# Altium project 2027_09_15_RVM_EF_ver0.4.PrjPcb
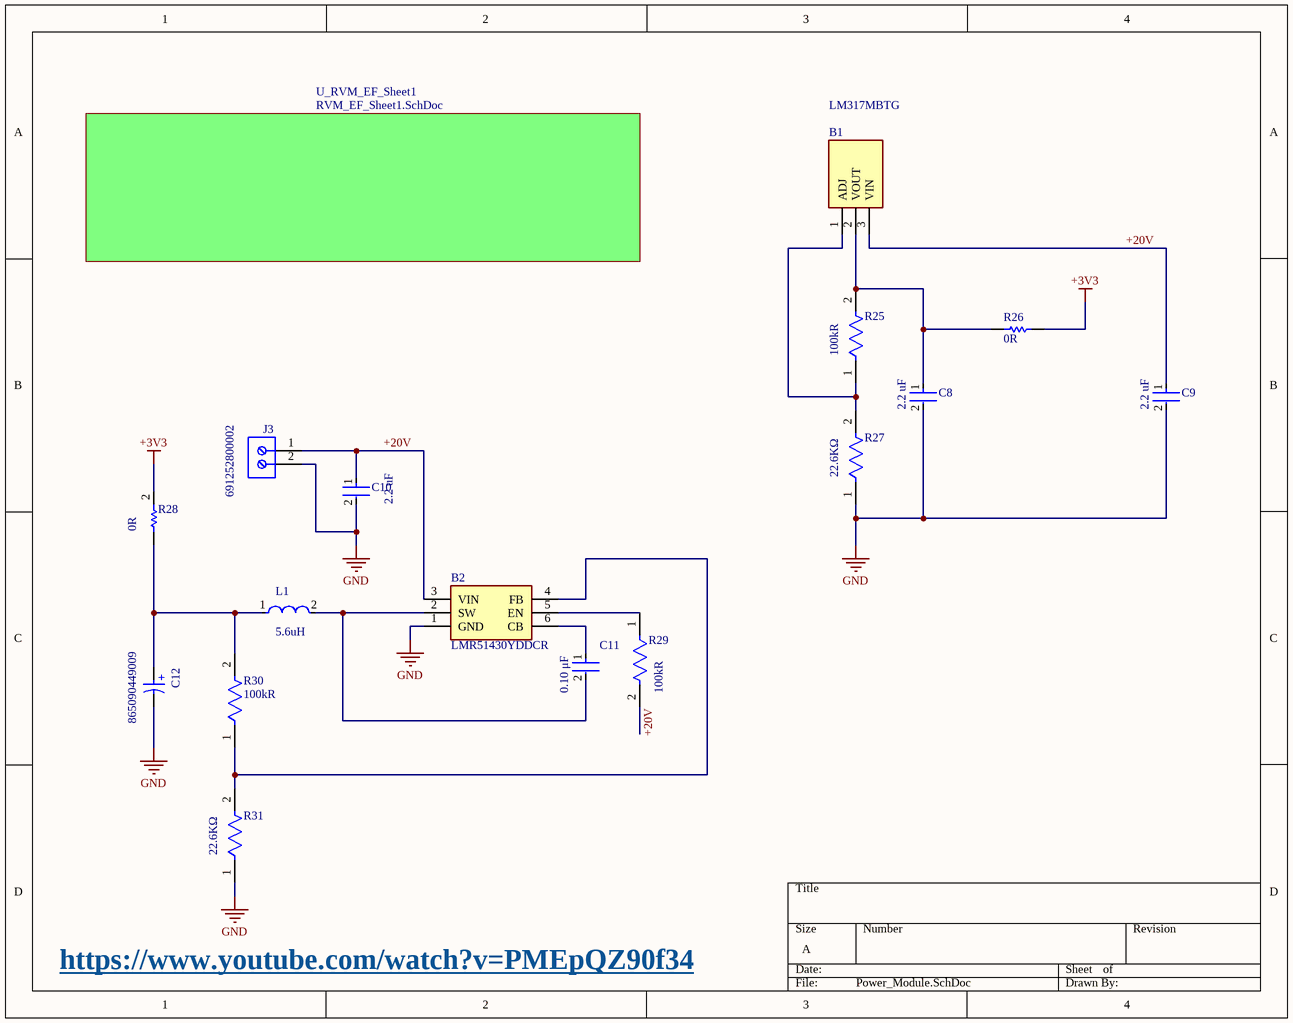
[diagram p0: Power_Module.SchDoc]
7 sheets, 92 parts. Net scope: flat (ports and power ports of the same name join across sheets).
Board file: RVM_EF_PCB1.PcbDoc
Sheets:
  Power_Module.SchDoc
    U_RVM_EF_Sheet1 = RVM_EF_Sheet1.SchDoc
      U_Voltage_Sense = Voltage_Sense.SchDoc
      U_Current_Sense = Current_Sense.SchDoc
      U_MCU_Module = MCU_Module.SchDoc
        U_LoRaModule = LoRaModule.SchDoc
        U_LED_blink = LED_blink.SchDoc

## Sheet Power_Module.SchDoc
size A; SheetNumber: 1; SheetTotal: 7

### Parts
B1  LM317MBTG  [TO254P482X997X2018-3P]
B2  LMR51430YDDCR  [SOT95P280X110-6N]
C8  value 2.2 uF  [FP-CC0805-0_85-MFG]  (hidden comment: CC0805KKX7R9BB225)
C9  value 2.2 uF  [FP-CC0805-0_85-MFG]  (hidden comment: CC0805KKX7R9BB225)
C10  value 2.2 uF  [FP-CC0805-0_85-MFG]  (hidden comment: CC0805KKX7R9BB225)
C11  value 0.10 μF  [FP-C1206C-EB-MFG]  (hidden comment: C1206C104F3GACTU)
C12  865090449009  [WCAP-ASLU_D8H6.5]
J3  691252800002  [691252800002]
L1  Inductance: 5.6uH  [FP-IHLP-3232CZ-FP_2_413x5-MFG]  (hidden comment: IHLP3232CZER5R6M01)
R25  Resistance: 100kR  [FP-MCU0805-IPC_B]  (hidden comment: MCU08050D1003BP500)
R26  value 0R  [RESC2013X60X35LL10T20]  (hidden comment: RC0805JR-130RL)
R27  value 22.6KΩ  [FP-RT0805-MFG]  (hidden comment: RT0805WRD0722K6L)
R28  value 0R  [RESC2013X60X35LL10T20]  (hidden comment: RC0805JR-130RL)
R29  Resistance: 100kR  [FP-MCU0805-IPC_B]  (hidden comment: MCU08050D1003BP500)
R30  Resistance: 100kR  [FP-MCU0805-IPC_B]  (hidden comment: MCU08050D1003BP500)
R31  value 22.6KΩ  [FP-RT0805-MFG]  (hidden comment: RT0805WRD0722K6L)

### Sub-sheets
U_RVM_EF_Sheet1 = RVM_EF_Sheet1.SchDoc: no entries

### Nets
+3V3: R26.1 R28.2
GND: B2.1(GND) C8.2 C9.2 C10.2 C12.2(N) J3.2 R27.1 R31.1
+20V: B1.3(VIN) B2.3(VIN) C9.1 C10.1 J3.1 R29.2
NetB1_1: B1.1(ADJ) R25.1 R27.2
NetB1_2: B1.2(VOUT) C8.1 R25.2 R26.2
NetB2_2: B2.2(SW) C11.2 L1.2
NetB2_4: B2.4(FB) R30.1 R31.2
NetB2_5: B2.5(EN) R29.1
NetB2_6: B2.6(CB) C11.1
NetC12_1: C12.1(P) L1.1 R28.1 R30.2

### Notes on the sheet
- https://www.youtube.com/watch?v=PMEpQZ90f34
- (in symbol CMP-03913-54202517-2) +

### Library data of the parts
B1 = LM317MBTG: Internal Short Circuit Current Limiting; Internal Thermal Overload Protection; Output Current in Excess of 500 mA; Output Transistor Safe-Area Compensation; Output Adjustable between 1.2 V and 37 V; Floating Operation for High Voltage Applications; Eliminates Stocking Many Fixed Voltages; Pb-Free Packages are Available; NCV Prefix for Automotive and Other Applications Requiring Site Control Changes; Manufacturer_Name: onsemi; Geometry.Height: 4.82mm; Mouser Part Number: 863-LM317MBTG; Mouser Price/Stock: https://www.mouser.co.uk/ProductDetail/onsemi/LM317MBTG?qs=2OtswVQKCOHWWQM%252BNYhxOw%3D%3D; Manufacturer_Part_Number: LM317MBTG; Datasheet Link: https://www.onsemi.com/pub/Collateral/LM317M-D.PDF
B2 = LMR51430YDDCR: Switching Voltage Regulators SIMPLE SWITCHER&reg; 4.5-V to 36-V, 3-A synchronous buck converter with 40-&micro;A IQ; Manufacturer_Name: Texas Instruments; Geometry.Height: 1.1mm; Mouser Part Number: 595-LMR51430YDDCR; Mouser Price/Stock: https://www.mouser.co.uk/ProductDetail/Texas-Instruments/LMR51430YDDCR?qs=vvQtp7zwQdMdLcsY5sFiMg%3D%3D; Manufacturer_Part_Number: LMR51430YDDCR; Datasheet Link: https://www.ti.com/lit/ds/symlink/lmr51430.pdf?ts=1657817980313&ref_url=https%253A%252F%252Fwww.ti.com%252Fproduct%252FLMR51430%253FkeyMatch%253DLMR51430%2526tisearch%253Dsearch-everything%2526usecase%253DGPN
C8-C10 = CMP-03422-001390-1: CAP CER 2.2UF 50V X7R 0805; Manufacturer: Yageo; Tolerance: 0.1; Material: Ceramic; ComponentLink2Description: Datasheet; ComponentLink2URL: http://www.yageo.com/documents/recent/UPY-GPHC_Y5V_6.3V-to-50V_8.pdf; Voltage Rating: 50 V; Device Class L2: Capacitors; Footprint Url: http://www.yageo.com/exep/pages/download/literatures/UPY-C_GEN_24.pdf; Device Class L3: Ceramic Capacitors; Temperature Range High: +85°C; Category: Cap; Lead Free: Yes; Height: 0.95mm; Automotive: No; Temperature Range Low: -30°C; Octopart: https://octopart.com/cc0805kkx7r9bb225-yageo-51849248; Temperature Characteristic: X7R; Ipc Land Pattern Name: CAPC200125X85; Mouser Description: 0805 50 V 2.2 uF ±10% Tolerance X7R Multilayer Ceramic Capacitor; RoHS: TRUE; Temperature: -30°C to +85°C; Capacitance: 2.2 uF; Package: CC0805-0.85; Digikey Description: CAP CER 2.2UF 50V X7R 0805; Manufacturer Part Number: CC0805KKX7R9BB225; Device Class L1: Passive Components
C11 = CMP-1037-04186-2: CAP CER 0.1UF 25V C0G/NP0 1206; Manufacturer: KEMET; Material: Ceramic; Temperature Characteristic: C0G; Temperature Coefficient: 15%; Tolerance: 0.01; Automotive Grade: Grade 0; Device Class L3: Ceramic Capacitors; Voltage Rating: 25 V; Temperature Range Low: -55°C; RoHS: TRUE; Package: C1206C-EB; Category: Cap; Lead Free: Yes; Manufacturer Part Number: C1206C104F3GACTU; ComponentLink2URL: https://content.kemet.com/datasheets/KEM_C1007_X8R_ULTRA_150C_SMD.pdf; Ipc Land Pattern Name: CAPC320160X78; Temperature Range High: +150°C; Height: 0.88mm; Digikey Description: CAP CER 0.1UF 25V C0G/NP0 1206; ComponentLink2Description: Datasheet; Capacitance: 0.10 μF; Mouser Description: Multilayer Ceramic Capacitors MLCC - SMD/SMT 25volts 0.1uF 1% C0G; Octopart: https://octopart.com/c1206c104f3gactu-kemet-13149870; Device Class L1: Passive Components; Device Class L2: Capacitors; Automotive: Yes; Temperature: -55°C to +150°C
C12 = CMP-03913-54202517-2: WCAP-ASLU Aluminum Electrolytic Capacitors; Capacitance: 100µF; Voltage Rating: 25V; Ripple Current: 110mA; Leakage Current: 5µA; Insulation Resistance: 1MΩ; Polarity: Polar; Life (Hours): 1000hours; Tolerance: 20%; Mount: Surface Mount; RoHS: Compliant; Max Operating Temperature: 85°C; Height: 6.5mm; Min Operating Temperature: -40°C; Case/Package: Radial; Length: 6.5mm; Width: 8.3mm; Voltage Rating (DC): 25V; Height - Seated (Max): 6.5024mm; Ripple Current (AC): 110mA; REACH SVHC: Unknown; Diameter: 8mm
J3 = CMP-1502-02796-3: Terminal Block, 10MM Pitch, Vertical, Rising Cage Clamp, 12-30 AWG, 2 Pin
L1 = CMP-02424-000712-1: Commercial Inductors, High Saturation Series 5.6uH 6.3A 37.2mΩ 20%; DC Resistance (DCR): 37.2mR; Test Frequency: 100kHz; Max DC Current: 10A; Shielding: Shielded; Self Resonant Frequency: 21MHz; Core Material: Ferrite; Length: 0.34inch; Package Quantity: 1000; Radiation Hardening: No; Saturation Current: 10A; Depth: 8.26mm; Inductance Tolerance: 20%; Current Rating: 6.3A; Packaging: Tape and Reel; Tolerance: 20%; Series: IHLP-3232CZ-01; Width: 8.18mm; RMS Current (Irms): 6.3A; Mount: Surface Mount; Case/Package: 3232; Termination: SMD/SMT; Rated Current-Max: 6.3A; Height: 3mm; Number of Pins: 2; Max Operating Temperature: 125°C; RoHS Compliant: Yes; Military Standard: Not; Lead Free: Lead Free; Min Operating Temperature: -55°C
R25 R29 R30 = CMP-02407-000489-1: RES 1.05K OHM 0.5% 1/5W 0805; Tolerance: 0.1%; Voltage Rating: 150V; Temperature Coefficient: 25ppm/°C; Power Rating: 125mW; REACH SVHC: No SVHC; Radiation Hardening: No; Composition: Thin Film; Contact Plating: Tin; Lead Free: Lead Free; Max Operating Temperature: 125°C; Width: 1.25mm; Case/Package: 0805; Depth: 1.25mm; Packaging: Tape and Reel; Case Code (Imperial): 0805; Length: 2mm; Case Code (Metric): 2012; Min Operating Temperature: -55°C; Voltage Rating (DC): 150V; Military Standard: Not
R26 R28 = CMP-2001-01414-1: Manufacturer: Yageo; Part Number: RC0805JR-130RL
R27 R31 = CMP-03412-025351-1: RES SMD 22.6KOHM 0.05% 1/8W 0805; Manufacturer: Yageo; Power Rating: 0.125W; Voltage Rating: 150V; Temperature Coefficient: 25 ppm/°C; Tolerance: 0.001; Footprint Url: http://www.yageo.com/exep/pages/download/literatures/PYu-R_Mount_10.pdf; Package: RT0805; Device Class L3: Chip SMD Resistors; Height: 0.6mm; Temperature Range High: +155°C; ComponentLink2Description: Datasheet; Manufacturer Part Number: RT0805WRD0722K6L; Temperature Range Low: -55°C; Temperature: -55°C to +155°C; Lead Free: Yes; Resistance: 22.6KΩ; Automotive: No; Series: RT; Digikey Description: RES SMD 22.6KOHM 0.05% 1/8W 0805; Octopart: https://octopart.com/rt0805wrd0722k6l-yageo-71401359; Category: Res; ComponentLink2URL: http://www.yageo.com/documents/recent/PYu-RT_1-to-0.01_RoHS_L_9.pdf; Ipc Land Pattern Name: RESC200125X50; Composition: Thin Film; Device Class L2: Resistors; Device Class L1: Passive Components; RoHS: TRUE

## Sheet RVM_EF_Sheet1.SchDoc
size A4; SheetNumber: 2; SheetTotal: 6
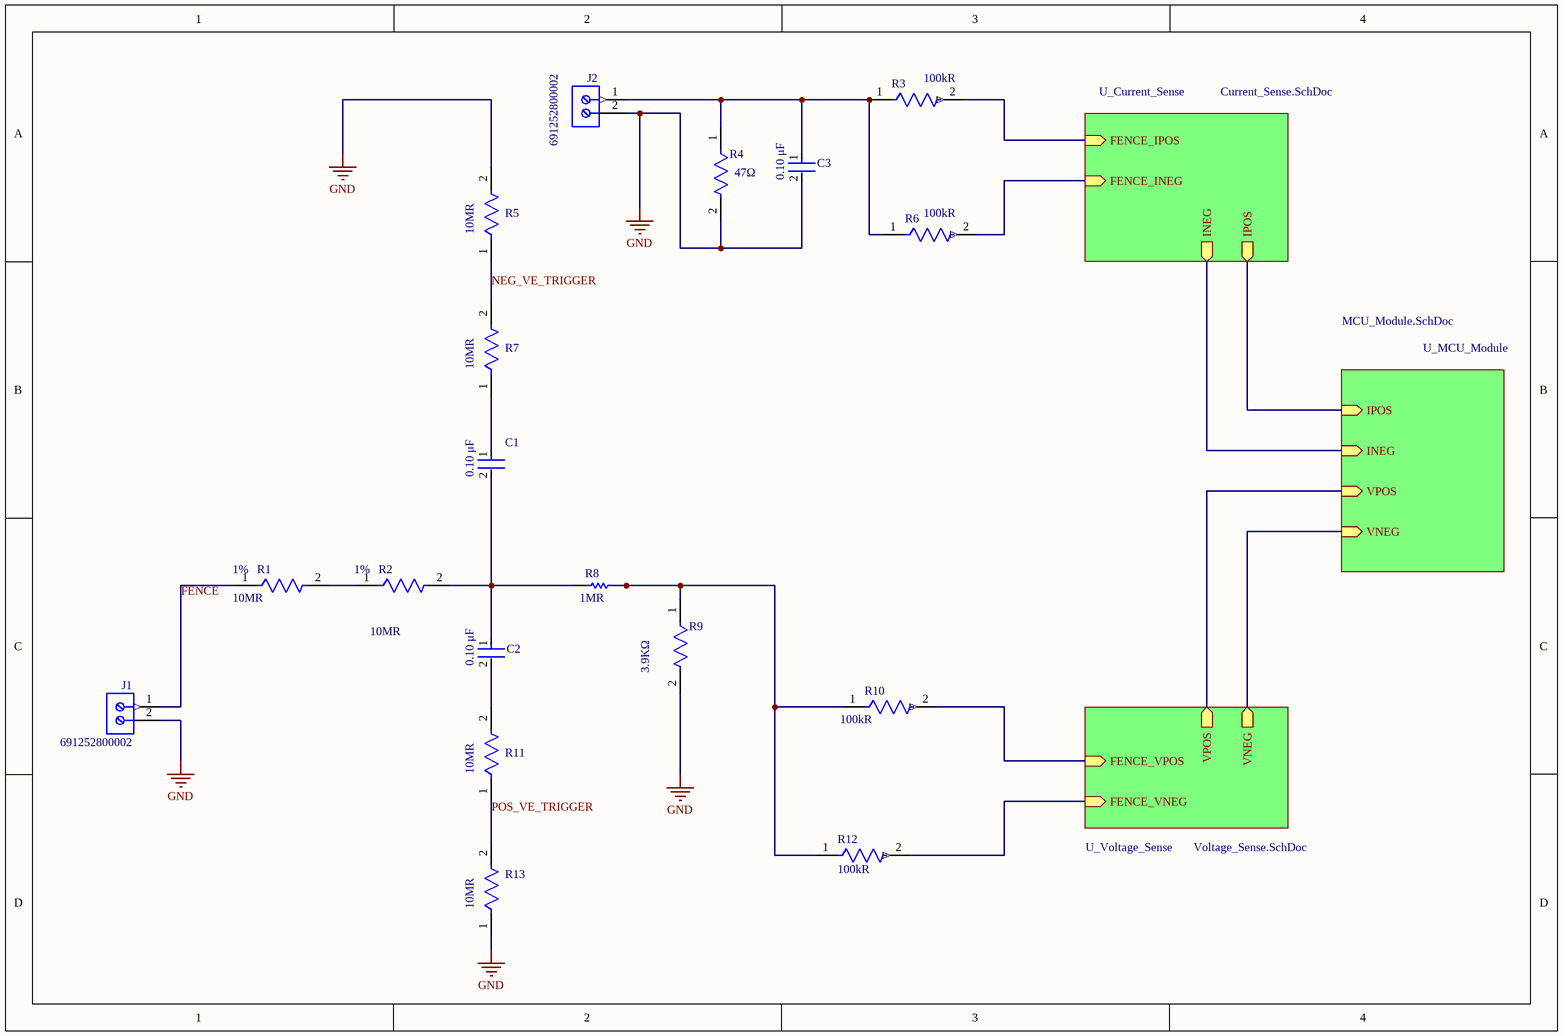
[diagram p1: RVM_EF_Sheet1.SchDoc]

### Parts
C1  value 0.10 μF  [FP-C1206C-EB-MFG]  (hidden comment: C1206C104F3GACTU)
C2  value 0.10 μF  [FP-C1206C-EB-MFG]  (hidden comment: C1206C104F3GACTU)
C3  value 0.10 μF  [FP-C1206C-EB-MFG]  (hidden comment: C1206C104F3GACTU)
J1  691252800002  [691252800002]
J2  691252800002  [691252800002]
R1  Tolerance: 1%  Resistance: 10MR  [FP-CRCW2512-e3-IPC_A]  (hidden comment: CRCW251210M0FKEH)
R2  Tolerance: 1%  Resistance: 10MR  [FP-CRCW2512-e3-IPC_A]  (hidden comment: CRCW251210M0FKEH)
R3  Resistance: 100kR  [FP-MCU0805-IPC_B]  (hidden comment: MCU08050D1003BP500)
R4  Resistance: 47Ω  [FP-RT1206-MFG]  (hidden comment: RT1206FRE0747RL)
R5  Resistance: 10MR  [FP-CRCW0805-e3-MFG]  (hidden comment: CRCW080510M0FKEC)
R6  Resistance: 100kR  [FP-MCU0805-IPC_B]  (hidden comment: MCU08050D1003BP500)
R7  Resistance: 10MR  [FP-CRCW0805-e3-MFG]  (hidden comment: CRCW080510M0FKEC)
R8  value 1MR  [RESC0805(2012)_N]  (hidden comment: 1M 1% 0805(2012))
R9  value 3.9KΩ  [FP-RT0805-MFG]  (hidden comment: RT0805DRD073K9L)
R10  Resistance: 100kR  [FP-MCU0805-IPC_B]  (hidden comment: MCU08050D1003BP500)
R11  Resistance: 10MR  [FP-CRCW0805-e3-MFG]  (hidden comment: CRCW080510M0FKEC)
R12  Resistance: 100kR  [FP-MCU0805-IPC_B]  (hidden comment: MCU08050D1003BP500)
R13  Resistance: 10MR  [FP-CRCW0805-e3-MFG]  (hidden comment: CRCW080510M0FKEC)

### Sub-sheets
U_Current_Sense = Current_Sense.SchDoc: FENCE_IPOS (in), FENCE_INEG (in), IPOS (out), INEG (out)
U_MCU_Module = MCU_Module.SchDoc: IPOS (in), INEG (in), VPOS (in), VNEG (in)
U_Voltage_Sense = Voltage_Sense.SchDoc: FENCE_VPOS (in), FENCE_VNEG (in), VPOS (out), VNEG (out)

### Nets
GND: C3.2 J1.2 J2.2 R4.2 R5.2 R9.2 R13.1
FENCE: J1.1 R1.1
NEG_VE_TRIGGER: R5.1 R7.2
POS_VE_TRIGGER: R11.1 R13.2
NetC1_1: C1.1 R7.1
NetC1_2: C1.2 C2.1 R2.2 R8.1
NetC2_2: C2.2 R11.2
NetC3_1: C3.1 J2.1 R3.1 R4.1 R6.1
NetR1_2: R1.2 R2.1
NetR3_2: R3.2 ; sheet U_Current_Sense/FENCE_IPOS
NetR6_2: R6.2 ; sheet U_Current_Sense/FENCE_INEG
NetR8_2: R8.2 R9.1 R10.1 R12.1
NetR10_2: R10.2 ; sheet U_Voltage_Sense/FENCE_VPOS
NetR12_2: R12.2 ; sheet U_Voltage_Sense/FENCE_VNEG
(unnamed): sheet U_Voltage_Sense/VPOS, sheet U_MCU_Module/VPOS
(unnamed): sheet U_Voltage_Sense/VNEG, sheet U_MCU_Module/VNEG
(unnamed): sheet U_Current_Sense/IPOS, sheet U_MCU_Module/IPOS
(unnamed): sheet U_Current_Sense/INEG, sheet U_MCU_Module/INEG

### Library data of the parts
C1-C3 = CMP-1037-04186-2: as C11 on sheet Power_Module; Device Class L3: Ceramic Capacitors; Voltage Rating: 25 V; Temperature Range Low: -55°C; RoHS: TRUE; Package: C1206C-EB; Category: Cap; Lead Free: Yes; Manufacturer Part Number: C1206C104F3GACTU; ComponentLink2URL: https://content.kemet.com/datasheets/KEM_C1007_X8R_ULTRA_150C_SMD.pdf; Ipc Land Pattern Name: CAPC320160X78; Temperature Range High: +150°C; Height: 0.88mm; Digikey Description: CAP CER 0.1UF 25V C0G/NP0 1206; ComponentLink2Description: Datasheet; Capacitance: 0.10 μF; Mouser Description: Multilayer Ceramic Capacitors MLCC - SMD/SMT 25volts 0.1uF 1% C0G; Octopart: https://octopart.com/c1206c104f3gactu-kemet-13149870; Device Class L1: Passive Components; Device Class L2: Capacitors; Automotive: Yes; Temperature: -55°C to +150°C
J1 J2 = CMP-1502-02796-3: as J3 on sheet Power_Module
R1 R2 = CMP-1018-00962-2: RES Thick Film, 10MΩ, 1%, 1W, 100ppm/°C, 2512; Height: 0.028inch; Min Operating Temperature: -55°C; Number of Terminations: 2; Lead Free: Lead Free; Composition: Thick Film; Packaging: Tape and Reel; Case/Package: 2512; Length: 0.248inch; Max Power Dissipation: 1W; Temperature Coefficient: 100ppm/°C; Max Operating Temperature: 155°C; Features: Automotive AEC-Q200; Width: 0.124inch
R3 R6 R10 R12 = CMP-02407-000489-1: as R25 on sheet Power_Module; REACH SVHC: No SVHC; Radiation Hardening: No; Composition: Thin Film; Contact Plating: Tin; Lead Free: Lead Free; Max Operating Temperature: 125°C; Width: 1.25mm; Case/Package: 0805; Depth: 1.25mm; Packaging: Tape and Reel; Case Code (Imperial): 0805; Length: 2mm; Case Code (Metric): 2012; Min Operating Temperature: -55°C; Voltage Rating (DC): 150V; Military Standard: Not
R4 = CMP-2003-04115-2: RES SMD 47 OHM 1% 1/4W 1206; Manufacturer: Yageo; Voltage Rating: 200V; Value: 47Ω; Temperature Coefficient: 50 ppm/°C; Tolerance: 0.0002; Power Rating: 0.25W; Temperature Range High: +155°C; Category: Res; Temperature Range Low: -55°C; Device Class L3: Chip SMD Resistors; Temperature: -55°C to +155°C; RoHS: TRUE; Composition: Thin Film; Digikey Description: RES SMD 47 OHM 1% 1/4W 1206; Lead Free: Yes; Series: RT; Automotive: No; ComponentLink2Description: Datasheet; Device Class L2: Resistors; Ipc Land Pattern Name: RESC310160X55; ComponentLink2URL: http://www.yageo.com/documents/recent/PYu-RT_1-to-0.01_RoHS_L_9.pdf; Manufacturer Part Number: RT1206FRE0747RL; Device Class L1: Passive Components; Mouser Description: Thin Film Resistors - SMD 1/4W 47 ohm 1% 50ppm; Package: RT1206; Octopart: https://octopart.com/rt1206fre0747rl-yageo-1461420; Footprint Url: http://www.yageo.com/exep/pages/download/literatures/PYu-R_Mount_10.pdf; Height: 0.65mm
R5 R7 R11 R13 = CMP-02407-002899-1: RES Thick Film, 10MΩ, 1%, 0.125W, 100ppm/°C, 0805; Max Power Dissipation: 125mW; Width: 0.049inch; Features: Automotive AEC-Q200; Max Operating Temperature: 155°C; Composition: Thick Film; Tolerance: 1%; Min Operating Temperature: -55°C; Lead Free: Lead Free; Depth: 1.25mm; Length: 0.079inch; Package Quantity: 20000; Height: 0.02inch; Military Standard: Not; Number of Terminations: 2; Case/Package: 0805; Packaging: Tape and Reel; Temperature Coefficient: 100ppm/°C
R8 = CMP-1013-00849-1: 1M 0.125W 1% 0805 (2012 Metric)  SMD; Case-Metric: 2012; Case-EIA: 0805; Technology: SMT; Power: 0.125 W; Tolerance: 1 %
R9 = CMP-03412-007263-1: RES SMD 3.9K OHM 0.5% 1/8W 0805; Manufacturer: Yageo; Voltage Rating: 150V; Power Rating: 0.125W; Tolerance: 0.01; Temperature Coefficient: 25 ppm/°C; Footprint Url: http://www.yageo.com/exep/pages/download/literatures/PYu-R_Mount_10.pdf; Package: RT0805; Ipc Land Pattern Name: RESC200125X50; Composition: Thin Film; Automotive: No; ComponentLink2Description: Datasheet; Height: 0.6mm; Device Class L1: Passive Components; Device Class L2: Resistors; ComponentLink2URL: http://www.yageo.com/documents/recent/PYu-RT_1-to-0.01_RoHS_L_9.pdf; Manufacturer Part Number: RT0805DRD073K9L; Temperature Range Low: -55°C; Digikey Description: RES SMD 3.9K OHM 0.5% 1/8W 0805; Series: RT; Octopart: https://octopart.com/rt0805drd073k9l-yageo-1265808; Resistance: 3.9KΩ; Temperature Range High: +155°C; RoHS: TRUE; Lead Free: Yes; Category: Res; Device Class L3: Chip SMD Resistors; Temperature: -55°C to +155°C

## Sheet Voltage_Sense.SchDoc
size A4; SheetNumber: 3; SheetTotal: 6
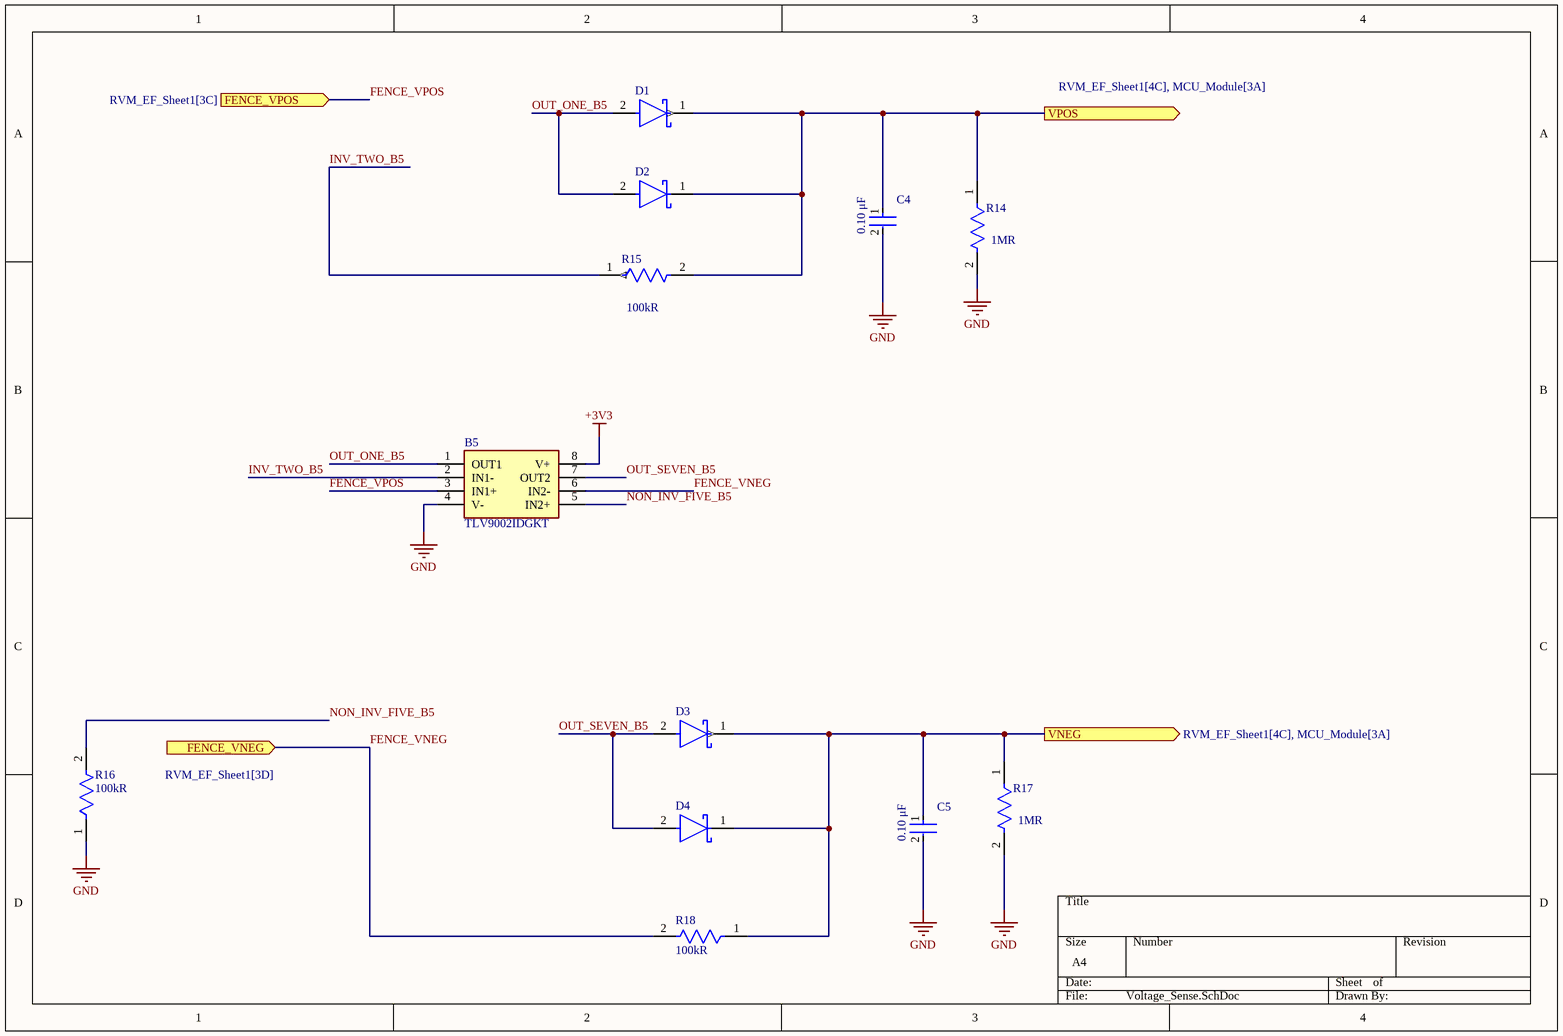
[diagram p2: Voltage_Sense.SchDoc]

### Parts
B5  TLV9002IDGKT  [SOIC127P610X140-8M]
C4  value 0.10 μF  [FP-C1206C-EB-MFG]  (hidden comment: C1206C104F3GACTU)
C5  value 0.10 μF  [FP-C1206C-EB-MFG]  (hidden comment: C1206C104F3GACTU)
D1  PMEG3010BER,115  [FP-SOD123W-MFG]  (value not drawn)
D2  PMEG3010BER,115  [FP-SOD123W-MFG]  (value not drawn)
D3  PMEG3010BER,115  [FP-SOD123W-MFG]  (value not drawn)
D4  PMEG3010BER,115  [FP-SOD123W-MFG]  (value not drawn)
R14  Resistance: 1MR  [FP-RMCF0805-IPC_A]  (hidden comment: RMCF0805FT1M00)
R15  Resistance: 100kR  [FP-MCU0805-IPC_B]  (hidden comment: MCU08050D1003BP500)
R16  Resistance: 100kR  [FP-MCU0805-IPC_B]  (hidden comment: MCU08050D1003BP500)
R17  Resistance: 1MR  [FP-RMCF0805-IPC_A]  (hidden comment: RMCF0805FT1M00)
R18  Resistance: 100kR  [FP-MCU0805-IPC_B]  (hidden comment: MCU08050D1003BP500)

### Ports
FENCE_VNEG (in, see RVM_EF_Sheet1[3D]), FENCE_VPOS (in, see RVM_EF_Sheet1[3C]), VNEG (out, see RVM_EF_Sheet1[4C], MCU_Module[3A]), VPOS (out, see RVM_EF_Sheet1[4C], MCU_Module[3A])

### Nets
+3V3: B5.8(V+)
GND: B5.4(V-) C4.2 C5.2 R14.2 R16.1 R17.2
FENCE_VNEG: B5.6(IN2-) R18.2 ; port FENCE_VNEG
FENCE_VPOS: B5.3(IN1+) ; port FENCE_VPOS
INV_TWO_B5: B5.2(IN1-) R15.1
NON_INV_FIVE_B5: B5.5(IN2+) R16.2
OUT_ONE_B5: B5.1(OUT1) D1.2(A) D2.2(A)
OUT_SEVEN_B5: B5.7(OUT2) D3.2(A) D4.2(A)
VNEG: C5.1 D3.1(K) D4.1(K) R17.1 R18.1 ; port VNEG
VPOS: C4.1 D1.1(K) D2.1(K) R14.1 R15.2 ; port VPOS

### Library data of the parts
B5 = TLV9002IDGKT: 2-Channel, 1MHz, RRIO, 1.8V to 5.5V Operational Amplifier for Cost-Optimized Systems; Manufacturer_Name: Texas Instruments; Geometry.Height: 1.1mm; Mouser Part Number: 595-TLV9002IDGKT; Mouser Price/Stock: https://www.mouser.co.uk/ProductDetail/Texas-Instruments/TLV9002IDGKT?qs=wUXugUrL1qxkc8vIM2YvZQ%3D%3D; Manufacturer_Part_Number: TLV9002IDGKT; Datasheet Link: https://www.ti.com/lit/ds/symlink/tlv9002.pdf?ts=1635497933449
C4 C5 = CMP-1037-04186-2: as C11 on sheet Power_Module; Device Class L3: Ceramic Capacitors; Voltage Rating: 25 V; Temperature Range Low: -55°C; RoHS: TRUE; Package: C1206C-EB; Category: Cap; Lead Free: Yes; Manufacturer Part Number: C1206C104F3GACTU; ComponentLink2URL: https://content.kemet.com/datasheets/KEM_C1007_X8R_ULTRA_150C_SMD.pdf; Ipc Land Pattern Name: CAPC320160X78; Temperature Range High: +150°C; Height: 0.88mm; Digikey Description: CAP CER 0.1UF 25V C0G/NP0 1206; ComponentLink2Description: Datasheet; Capacitance: 0.10 μF; Mouser Description: Multilayer Ceramic Capacitors MLCC - SMD/SMT 25volts 0.1uF 1% C0G; Octopart: https://octopart.com/c1206c104f3gactu-kemet-13149870; Device Class L1: Passive Components; Device Class L2: Capacitors; Automotive: Yes; Temperature: -55°C to +150°C
D1-D4 = CMP-14398-000004-1: DIODE SCHOTTKY 30V 1A SOD123W; Manufacturer: Nexperia; Automotive Grade: Grade 0; Max Surge Forward Current: 50A; Peak Reverse Current: 15uA; Max Junction Temp: +150°C; Capacitance: 170pF; Value: 170pF; ComponentLink2URL: https://assets.nexperia.com/documents/data-sheet/PMEG3010BER.pdf; Reverse Voltage: 30V; Forward Current: 1A; Ambient Temperature Range Low: -55°C; Ambient Temperature Range High: +150°C; Octopart: https://octopart.com/pmeg3010ber%2C115-nexperia-78741454; Package: SOD123W; Category: Diode; Lead Free: Yes; Digikey Description: DIODE SCHOTTKY 30V 1A SOD123W; Automotive: Yes; RoHS: TRUE; Height: 1.1mm; Temperature: to +150°C; Device Class L2: Diodes; ComponentLink2Description: Datasheet; Manufacturer Part Number: PMEG3010BER,115; Temperature Range High: +150°C; Device Class L3: Schottky Diodes; Device Class L1: Discrete Semiconductors; Footprint Url: https://assets.nexperia.com/documents/outline-drawing/SOD123W.pdf
R14 R17 = CMP-26527-007472-1: 1MΩ ±1% 0.125W 0805 Thick Film Chip Resistor AEC-Q200 compliant; Max Power Dissipation: 125mW; Temperature Coefficient: 100ppm/°C; Lead Free: Lead Free; Depth: 1.25mm; Power Rating: 125mW; Mount: Surface Mount; Length: 2mm; Max Operating Temperature: 155°C; Packaging: Tape and Reel; Size Code: 0805; Contact Plating: Tin; Min Operating Temperature: -55°C; Resistor Type: Thick Film; Height: 0.026inch; Military Standard: Not; Features: Automotive AEC-Q200; Radiation Hardening: No; Case Code (Metric): 2012; Tolerance: 1%; Construction: Rectangular; RoHS Compliant: Yes; Number of Terminations: 2; Width: 0.049inch; Case Code (Imperial): 0805; Case/Package: 0805; Series: RMCF
R15 R16 R18 = CMP-02407-000489-1: as R25 on sheet Power_Module; REACH SVHC: No SVHC; Radiation Hardening: No; Composition: Thin Film; Contact Plating: Tin; Lead Free: Lead Free; Max Operating Temperature: 125°C; Width: 1.25mm; Case/Package: 0805; Depth: 1.25mm; Packaging: Tape and Reel; Case Code (Imperial): 0805; Length: 2mm; Case Code (Metric): 2012; Min Operating Temperature: -55°C; Voltage Rating (DC): 150V; Military Standard: Not

## Sheet Current_Sense.SchDoc
size A4; SheetNumber: 4; SheetTotal: 7
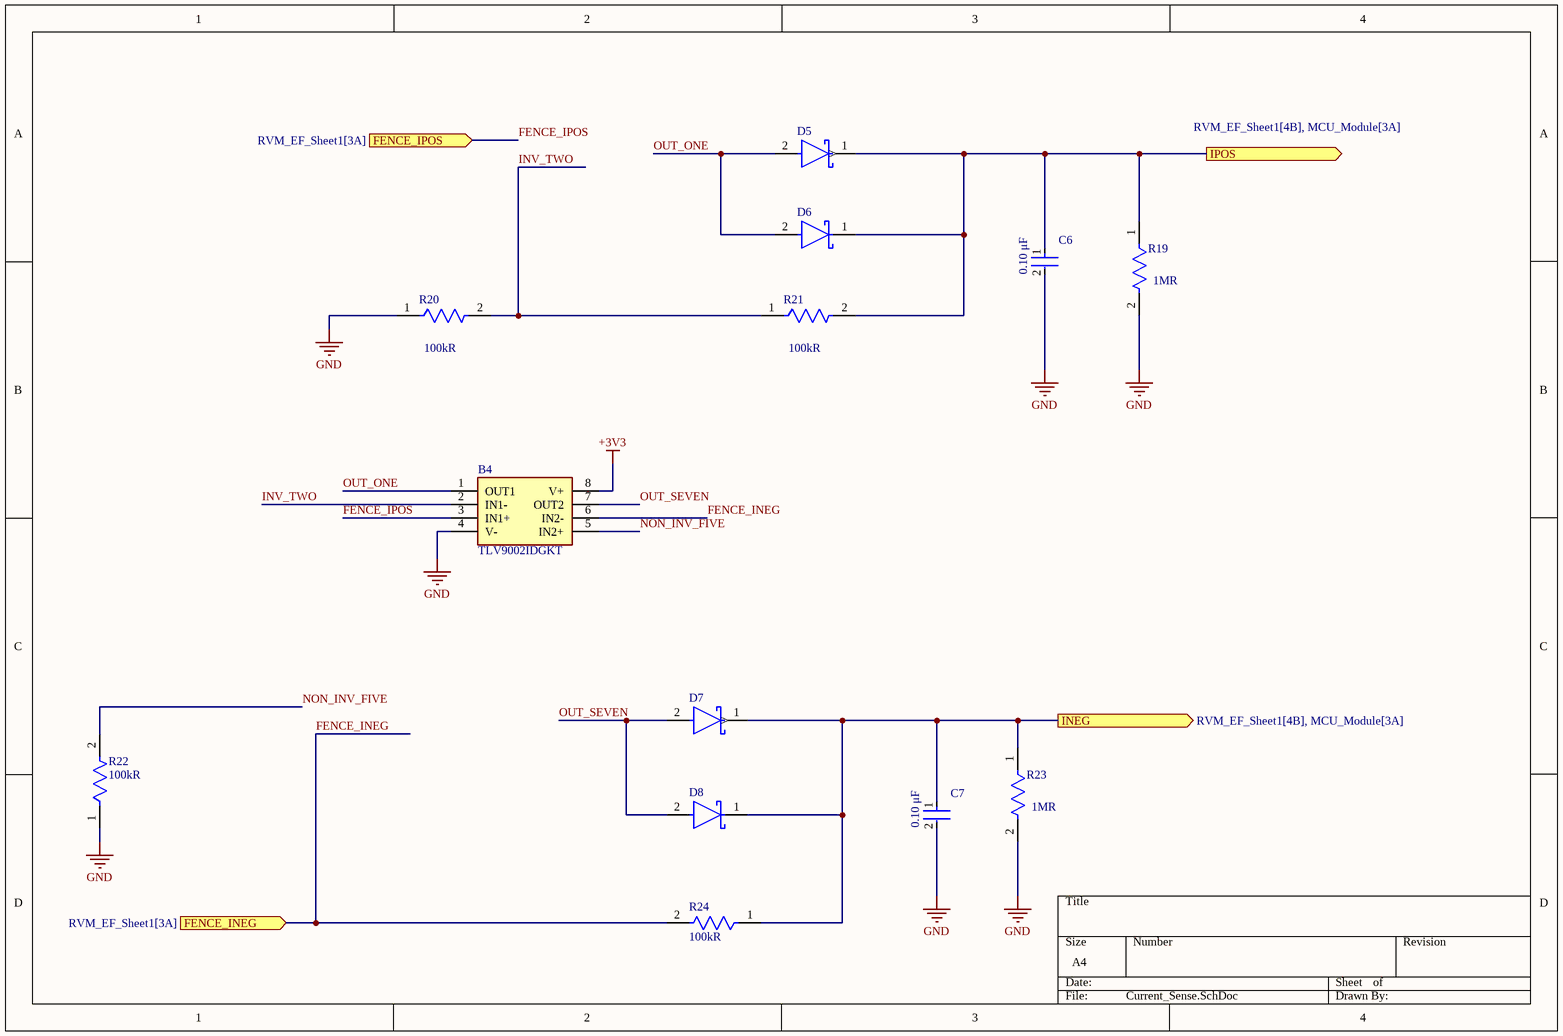
[diagram p3: Current_Sense.SchDoc]

### Parts
B4  TLV9002IDGKT  [SOIC127P610X140-8M]
C6  value 0.10 μF  [FP-C1206C-EB-MFG]  (hidden comment: C1206C104F3GACTU)
C7  value 0.10 μF  [FP-C1206C-EB-MFG]  (hidden comment: C1206C104F3GACTU)
D5  PMEG3010BER,115  [FP-SOD123W-MFG]  (value not drawn)
D6  PMEG3010BER,115  [FP-SOD123W-MFG]  (value not drawn)
D7  PMEG3010BER,115  [FP-SOD123W-MFG]  (value not drawn)
D8  PMEG3010BER,115  [FP-SOD123W-MFG]  (value not drawn)
R19  Resistance: 1MR  [FP-RMCF0805-IPC_A]  (hidden comment: RMCF0805FT1M00)
R20  Resistance: 100kR  [FP-MCU0805-IPC_B]  (hidden comment: MCU08050D1003BP500)
R21  Resistance: 100kR  [FP-MCU0805-IPC_B]  (hidden comment: MCU08050D1003BP500)
R22  Resistance: 100kR  [FP-MCU0805-IPC_B]  (hidden comment: MCU08050D1003BP500)
R23  Resistance: 1MR  [FP-RMCF0805-IPC_A]  (hidden comment: RMCF0805FT1M00)
R24  Resistance: 100kR  [FP-MCU0805-IPC_B]  (hidden comment: MCU08050D1003BP500)

### Ports
FENCE_INEG (in, see RVM_EF_Sheet1[3A]), FENCE_IPOS (in, see RVM_EF_Sheet1[3A]), INEG (out, see RVM_EF_Sheet1[4B], MCU_Module[3A]), IPOS (out, see RVM_EF_Sheet1[4B], MCU_Module[3A])

### Nets
+3V3: B4.8(V+)
GND: B4.4(V-) C6.2 C7.2 R19.2 R20.1 R22.1 R23.2
FENCE_INEG: B4.6(IN2-) R24.2 ; port FENCE_INEG
FENCE_IPOS: B4.3(IN1+) ; port FENCE_IPOS
INEG: C7.1 D7.1(K) D8.1(K) R23.1 R24.1 ; port INEG
INV_TWO: B4.2(IN1-) R20.2 R21.1
IPOS: C6.1 D5.1(K) D6.1(K) R19.1 R21.2 ; port IPOS
NON_INV_FIVE: B4.5(IN2+) R22.2
OUT_ONE: B4.1(OUT1) D5.2(A) D6.2(A)
OUT_SEVEN: B4.7(OUT2) D7.2(A) D8.2(A)

### Library data of the parts
B4 = TLV9002IDGKT: as B5 on sheet Voltage_Sense; Mouser Part Number: 595-TLV9002IDGKT; Mouser Price/Stock: https://www.mouser.co.uk/ProductDetail/Texas-Instruments/TLV9002IDGKT?qs=wUXugUrL1qxkc8vIM2YvZQ%3D%3D; Manufacturer_Part_Number: TLV9002IDGKT; Datasheet Link: https://www.ti.com/lit/ds/symlink/tlv9002.pdf?ts=1635497933449
C6 C7 = CMP-1037-04186-2: as C11 on sheet Power_Module; Device Class L3: Ceramic Capacitors; Voltage Rating: 25 V; Temperature Range Low: -55°C; RoHS: TRUE; Package: C1206C-EB; Category: Cap; Lead Free: Yes; Manufacturer Part Number: C1206C104F3GACTU; ComponentLink2URL: https://content.kemet.com/datasheets/KEM_C1007_X8R_ULTRA_150C_SMD.pdf; Ipc Land Pattern Name: CAPC320160X78; Temperature Range High: +150°C; Height: 0.88mm; Digikey Description: CAP CER 0.1UF 25V C0G/NP0 1206; ComponentLink2Description: Datasheet; Capacitance: 0.10 μF; Mouser Description: Multilayer Ceramic Capacitors MLCC - SMD/SMT 25volts 0.1uF 1% C0G; Octopart: https://octopart.com/c1206c104f3gactu-kemet-13149870; Device Class L1: Passive Components; Device Class L2: Capacitors; Automotive: Yes; Temperature: -55°C to +150°C
D5-D8 = CMP-14398-000004-1: as D1 on sheet Voltage_Sense; ComponentLink2URL: https://assets.nexperia.com/documents/data-sheet/PMEG3010BER.pdf; Reverse Voltage: 30V; Forward Current: 1A; Ambient Temperature Range Low: -55°C; Ambient Temperature Range High: +150°C; Octopart: https://octopart.com/pmeg3010ber%2C115-nexperia-78741454; Package: SOD123W; Category: Diode; Lead Free: Yes; Digikey Description: DIODE SCHOTTKY 30V 1A SOD123W; Automotive: Yes; RoHS: TRUE; Height: 1.1mm; Temperature: to +150°C; Device Class L2: Diodes; ComponentLink2Description: Datasheet; Manufacturer Part Number: PMEG3010BER,115; Temperature Range High: +150°C; Device Class L3: Schottky Diodes; Device Class L1: Discrete Semiconductors; Footprint Url: https://assets.nexperia.com/documents/outline-drawing/SOD123W.pdf
R19 R23 = CMP-26527-007472-1: as R14 on sheet Voltage_Sense; Lead Free: Lead Free; Depth: 1.25mm; Power Rating: 125mW; Mount: Surface Mount; Length: 2mm; Max Operating Temperature: 155°C; Packaging: Tape and Reel; Size Code: 0805; Contact Plating: Tin; Min Operating Temperature: -55°C; Resistor Type: Thick Film; Height: 0.026inch; Military Standard: Not; Features: Automotive AEC-Q200; Radiation Hardening: No; Case Code (Metric): 2012; Tolerance: 1%; Construction: Rectangular; RoHS Compliant: Yes; Number of Terminations: 2; Width: 0.049inch; Case Code (Imperial): 0805; Case/Package: 0805; Series: RMCF
R20-R22 R24 = CMP-02407-000489-1: as R25 on sheet Power_Module; REACH SVHC: No SVHC; Radiation Hardening: No; Composition: Thin Film; Contact Plating: Tin; Lead Free: Lead Free; Max Operating Temperature: 125°C; Width: 1.25mm; Case/Package: 0805; Depth: 1.25mm; Packaging: Tape and Reel; Case Code (Imperial): 0805; Length: 2mm; Case Code (Metric): 2012; Min Operating Temperature: -55°C; Voltage Rating (DC): 150V; Military Standard: Not

## Sheet MCU_Module.SchDoc
size A4; SheetNumber: 5; SheetTotal: 7
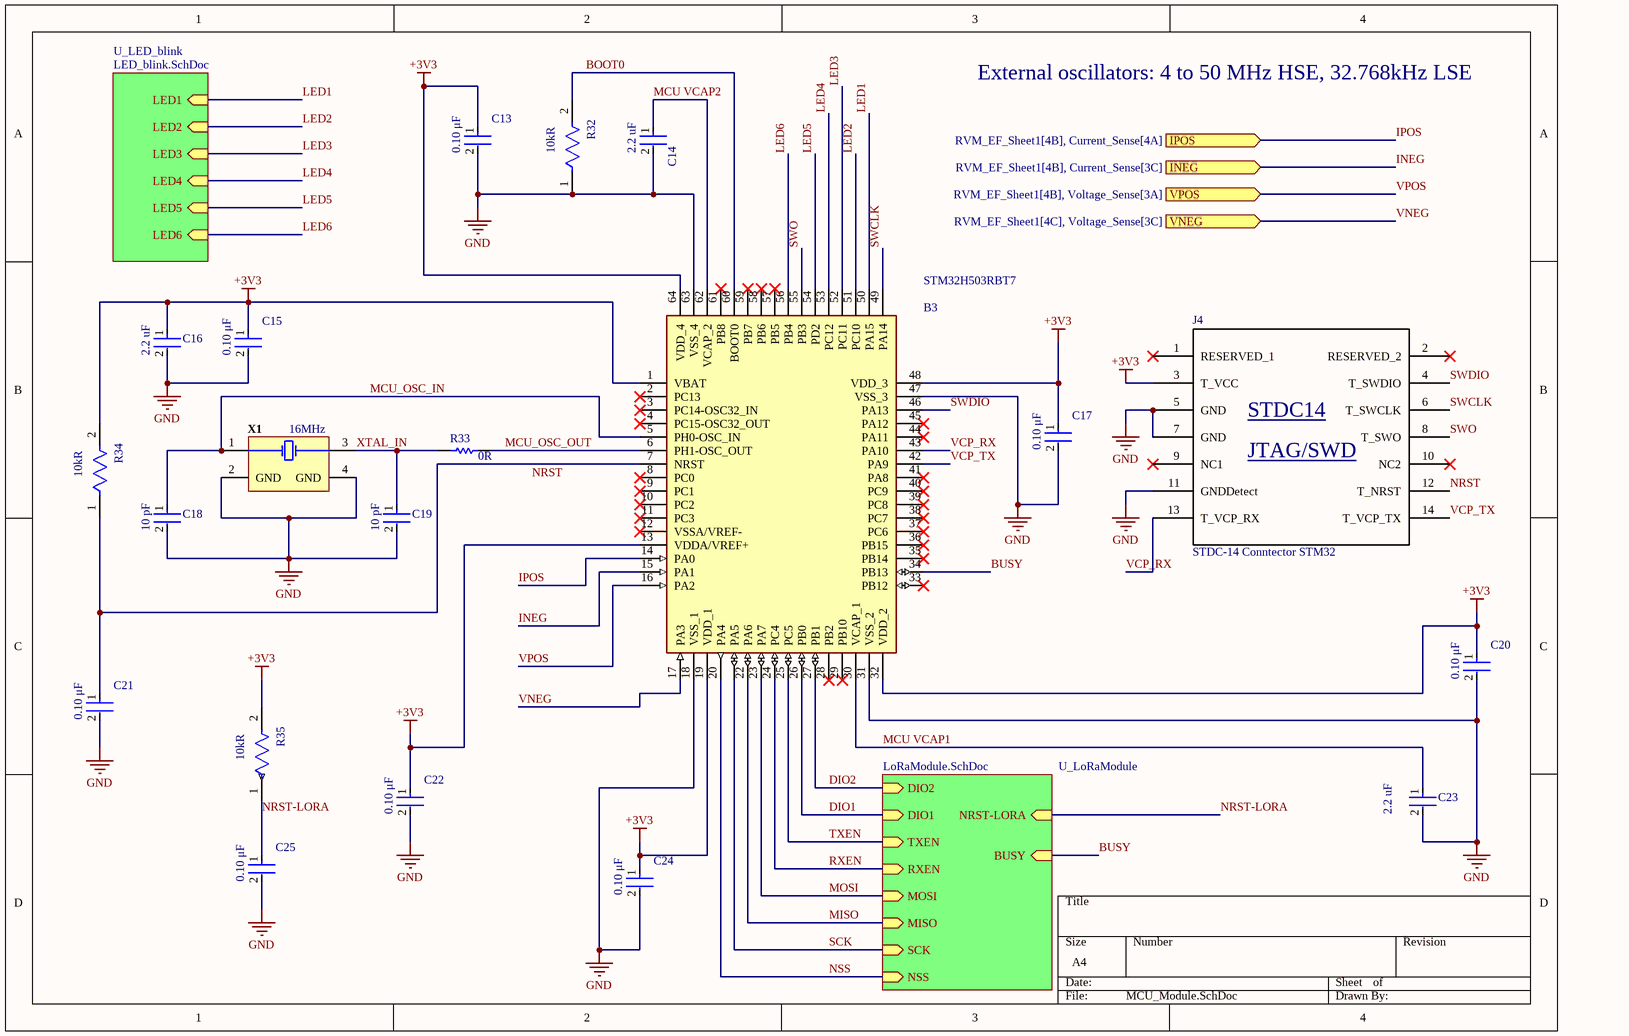
[diagram p4: MCU_Module.SchDoc]

### Parts
B3  STM32H503RBT7  [QFP50P1200X1200X160-64N]
C13  value 0.10 μF  [FP-C1206C-EB-MFG]  (hidden comment: C1206C104F3GACTU)
C14  value 2.2 uF  [FP-CC0805-0_85-MFG]  (hidden comment: CC0805KKX7R9BB225)
C15  value 0.10 μF  [FP-C1206C-EB-MFG]  (hidden comment: C1206C104F3GACTU)
C16  value 2.2 uF  [FP-CC0805-0_85-MFG]  (hidden comment: CC0805KKX7R9BB225)
C17  value 0.10 μF  [FP-C1206C-EB-MFG]  (hidden comment: C1206C104F3GACTU)
C18  value 10 pF  [FP-C0805C-DN-MFG]  (hidden comment: C0805C100JAGACTU)
C19  value 10 pF  [FP-C0805C-DN-MFG]  (hidden comment: C0805C100JAGACTU)
C20  value 0.10 μF  [FP-C1206C-EB-MFG]  (hidden comment: C1206C104F3GACTU)
C21  value 0.10 μF  [FP-C1206C-EB-MFG]  (hidden comment: C1206C104F3GACTU)
C22  value 0.10 μF  [FP-C1206C-EB-MFG]  (hidden comment: C1206C104F3GACTU)
C23  value 2.2 uF  [FP-CC0805-0_85-MFG]  (hidden comment: CC0805KKX7R9BB225)
C24  value 0.10 μF  [FP-C1206C-EB-MFG]  (hidden comment: C1206C104F3GACTU)
C25  value 0.10 μF  [FP-C1206C-EB-MFG]  (hidden comment: C1206C104F3GACTU)
J4  STDC-14 Conntector STM32  [DIP14]
R32  Resistance: 10kR  [FP-RMCF0805-IPC_A]  (hidden comment: RMCF0805FG10K0)
R33  value 0R  [RESC2013X60X35LL10T20]  (hidden comment: RC0805JR-130RL)
R34  Resistance: 10kR  [FP-RMCF0805-IPC_A]  (hidden comment: RMCF0805FG10K0)
R35  Resistance: 10kR  [FP-RMCF0805-IPC_A]  (hidden comment: RMCF0805FG10K0)
X1  Frequency: 16MHz  [EPSON-TSX-3225_V]  (hidden comment: TSX-3225 16.0000MF09Z-AC3)

### Sub-sheets
U_LED_blink = LED_blink.SchDoc: LED1 (in), LED2 (in), LED3 (in), LED4 (in), LED5 (in), LED6 (in)
U_LoRaModule = LoRaModule.SchDoc: BUSY (in), NRST-LORA (in), MISO (in), SCK (in), TXEN (in), RXEN (in), DIO2 (in), DIO1 (in), MOSI (in), NSS (in)

### Ports
INEG (in, see RVM_EF_Sheet1[4B], Current_Sense[3C]), IPOS (in, see RVM_EF_Sheet1[4B], Current_Sense[4A]), VNEG (in, see RVM_EF_Sheet1[4C], Voltage_Sense[3C]), VPOS (in, see RVM_EF_Sheet1[4B], Voltage_Sense[3A])

### Nets
+3V3: B3.1(VBAT) B3.13(VDDA/VREF+) B3.19(VDD_1) B3.32(VDD_2) B3.48(VDD_3) B3.64(VDD_4) C13.1 C15.1 C16.1 C17.1 C20.1 C22.1 C24.1 J4.3(T_VCC) R34.2 R35.2
GND: B3.18(VSS_1) B3.31(VSS_2) B3.47(VSS_3) B3.63(VSS_4) C13.2 C14.2 C15.2 C16.2 C17.2 C18.2 C19.2 C20.2 C21.2 C22.2 C23.2 C24.2 C25.2 J4.5(GND) J4.7(GND) J4.11(GNDDetect) R32.1 X1.2(GND) X1.4(GND)
BOOT0: B3.60(BOOT0) R32.2
BUSY: B3.34(PB13) ; sheet U_LoRaModule/BUSY
DIO1: B3.26(PB0) ; sheet U_LoRaModule/DIO1
DIO2: B3.27(PB1) ; sheet U_LoRaModule/DIO2
INEG: B3.15(PA1) ; port INEG
IPOS: B3.14(PA0) ; port IPOS
LED1: B3.50(PA15) ; sheet U_LED_blink/LED1
LED2: B3.51(PC10) ; sheet U_LED_blink/LED2
LED3: B3.52(PC11) ; sheet U_LED_blink/LED3
LED4: B3.53(PC12) ; sheet U_LED_blink/LED4
LED5: B3.54(PD2) ; sheet U_LED_blink/LED5
LED6: B3.56(PB4) ; sheet U_LED_blink/LED6
MCU VCAP1: B3.30(VCAP_1) C23.1
MCU VCAP2: B3.62(VCAP_2) C14.1
MCU_OSC_IN: B3.5(PH0-OSC_IN) C18.1 X1.1(X1)
MCU_OSC_OUT: B3.6(PH1-OSC_OUT) R33.1
MISO: B3.22(PA6) ; sheet U_LoRaModule/MISO
MOSI: B3.23(PA7) ; sheet U_LoRaModule/MOSI
NRST: B3.7(NRST) C21.1 J4.12(T_NRST) R34.1
NRST-LORA: C25.1 R35.1 ; sheet U_LoRaModule/NRST-LORA
NSS: B3.20(PA4) ; sheet U_LoRaModule/NSS
RXEN: B3.24(PC4) ; sheet U_LoRaModule/RXEN
SCK: B3.21(PA5) ; sheet U_LoRaModule/SCK
SWCLK: B3.49(PA14) J4.6(T_SWCLK)
SWDIO: B3.46(PA13) J4.4(T_SWDIO)
SWO: B3.55(PB3) J4.8(T_SWO)
TXEN: B3.25(PC5) ; sheet U_LoRaModule/TXEN
VCP_RX: B3.43(PA10) J4.13(T_VCP_RX)
VCP_TX: B3.42(PA9) J4.14(T_VCP_TX)
VNEG: B3.17(PA3) ; port VNEG
VPOS: B3.16(PA2) ; port VPOS
XTAL_IN: C19.1 R33.2 X1.3(X2)

Not connected (* = marked no-connect by the designer): B3 2(PC13)* 3(PC14-OSC32_IN)* 4(PC15-OSC32_OUT)* 8(PC0)* 9(PC1)* 10(PC2)* 11(PC3)* 12(VSSA/VREF-)* 28(PB2)* 29(PB10)* 33(PB12)* 35(PB14)* 36(PB15)* 37(PC6)* 38(PC7)* 39(PC8)* 40(PC9)* 41(PA8)* 44(PA11)* 45(PA12)* 57(PB5)* 58(PB6)* 59(PB7)* 61(PB8)*; J4 1(RESERVED_1)* 2(RESERVED_2)* 9(NC1)* 10(NC2)*

### Notes on the sheet
- External oscillators: 4 to 50 MHz HSE, 32.768kHz LSE
- (in symbol STDC14) JTAG/SWD

### Library data of the parts
B3 = STM32H503RBT7: Arm Cortex-M33 32-bit MCU+FPU, 375 DMIPS, 250 MHz, 128 Kbytes flash memory, 32 Kbytes RAM, I3C; Manufacturer_Name: STMicroelectronics; Geometry.Height: 1.6mm; Mouser Part Number: 511-STM32H503RBT7; Mouser Price/Stock: https://www.mouser.co.uk/ProductDetail/STMicroelectronics/STM32H503RBT7?qs=Z%252BL2brAPG1Lgew3845jGyA%3D%3D; Manufacturer_Part_Number: STM32H503RBT7; Datasheet Link: https://www.st.com/resource/en/datasheet/stm32h503eb.pdf
C13 C15 C17 C20-C22 C24 C25 = CMP-1037-04186-2: as C11 on sheet Power_Module; Device Class L3: Ceramic Capacitors; Voltage Rating: 25 V; Temperature Range Low: -55°C; RoHS: TRUE; Package: C1206C-EB; Category: Cap; Lead Free: Yes; Manufacturer Part Number: C1206C104F3GACTU; ComponentLink2URL: https://content.kemet.com/datasheets/KEM_C1007_X8R_ULTRA_150C_SMD.pdf; Ipc Land Pattern Name: CAPC320160X78; Temperature Range High: +150°C; Height: 0.88mm; Digikey Description: CAP CER 0.1UF 25V C0G/NP0 1206; ComponentLink2Description: Datasheet; Capacitance: 0.10 μF; Mouser Description: Multilayer Ceramic Capacitors MLCC - SMD/SMT 25volts 0.1uF 1% C0G; Octopart: https://octopart.com/c1206c104f3gactu-kemet-13149870; Device Class L1: Passive Components; Device Class L2: Capacitors; Automotive: Yes; Temperature: -55°C to +150°C
C14 C16 C23 = CMP-03422-001390-1: as C8 on sheet Power_Module; ComponentLink2Description: Datasheet; ComponentLink2URL: http://www.yageo.com/documents/recent/UPY-GPHC_Y5V_6.3V-to-50V_8.pdf; Voltage Rating: 50 V; Device Class L2: Capacitors; Footprint Url: http://www.yageo.com/exep/pages/download/literatures/UPY-C_GEN_24.pdf; Device Class L3: Ceramic Capacitors; Temperature Range High: +85°C; Category: Cap; Lead Free: Yes; Height: 0.95mm; Automotive: No; Temperature Range Low: -30°C; Octopart: https://octopart.com/cc0805kkx7r9bb225-yageo-51849248; Temperature Characteristic: X7R; Ipc Land Pattern Name: CAPC200125X85; Mouser Description: 0805 50 V 2.2 uF ±10% Tolerance X7R Multilayer Ceramic Capacitor; RoHS: TRUE; Temperature: -30°C to +85°C; Capacitance: 2.2 uF; Package: CC0805-0.85; Digikey Description: CAP CER 2.2UF 50V X7R 0805; Manufacturer Part Number: CC0805KKX7R9BB225; Device Class L1: Passive Components
C18 C19 = CMP-03020-028919-1: C0805 10 pF C0G 30ppm/°C 5.00% 250 V; Manufacturer: KEMET; Tolerance: 0.05; Voltage Rating: 250 V; Material: Ceramic; Temperature Range High: +125°C; Temperature: -55°C to +125°C; Temperature Characteristic: C0G; Height: 0.88mm; Package: C0805C-DN; Automotive: No; Capacitance: 10 pF; Device Class L1: Passive Components; RoHS: TRUE; Manufacturer Part Number: C0805C100JAGACTU; Ipc Land Pattern Name: CAPC200125X78; Device Class L2: Capacitors; ComponentLink2Description: Datasheet; Temperature Range Low: -55°C; ComponentLink2URL: https://content.kemet.com/datasheets/KEM_C1003_C0G_SMD.pdf; Lead Free: Yes; Temperature Coefficient: 30ppm/°C; Octopart: https://octopart.com/c0805c100jagactu-kemet-88373098; Category: Cap; Device Class L3: Ceramic Capacitors
J4 = STDC14
R32 R34 R35 = CMP-26527-002739-1: 10kΩ ±1% 0.125W 0805 Thick Film Chip Resistor AEC-Q200 compliant; Max Power Dissipation: 125mW; Temperature Coefficient: 100ppm/°C; Construction: Rectangular; Case/Package: 0805; Contact Plating: Tin; RoHS Compliant: Yes; Mount: Surface Mount; Case Code (Metric): 2012; Radiation Hardening: No; Packaging: Tape and Reel; Case Code (Imperial): 0805; Tolerance: 1%; Max Operating Temperature: 155°C; Length: 0.079inch; Min Operating Temperature: -55°C; Features: Automotive AEC-Q200; Width: 0.049inch; Height: 0.026inch; Depth: 1.25mm; Number of Terminations: 2; Resistor Type: Thick Film; Series: RMCF; Military Standard: Not
R33 = CMP-2001-01414-1: Manufacturer: Yageo; Part Number: RC0805JR-130RL
X1 = CMP-2000-07331-1: Crystal, 16 MHz, -40 to 85 degC, 4-Pin SMD, RoHS, Tape and Reel; Manufacturer: Epson; ESR: 60Ohms; Brand: EpsonTiming; Load Capacitance: 9pF; Frequency Stability: 10PPM; Unit Weight: 0.000564oz; Drive Level: 200uW; Factory Pack Quantity: 250; Mounting Style: SMD/SMT; Packaging: Reel; Datasheet URL: https://support.epson.biz/td/api/doc_check.php?dl=brief_FA-238V_en.pdf; Datasheet Version: 12/2015; Package Reference: TSX-3225; Series: TSX-3225; Package / Case: 3.2mmx2.5mm; Package Description: 4-Pin Surface Mount Device, Body 3.2 x 2.5 mm; Type: Crystal; Height: 0.6mm; Manufacturer URL: https://www.eea.epson.com/; Operating Temperature Range: -20Cto+75C; Length: 3.2mm; Width: 2.5mm; RoHS: True; Mounting Technology: SurfaceMount; Termination Style: SMD/SMT; Product Category: Crystals; Tolerance: 10PPM

## Sheet LoRaModule.SchDoc
size A; SheetNumber: 6; SheetTotal: 6
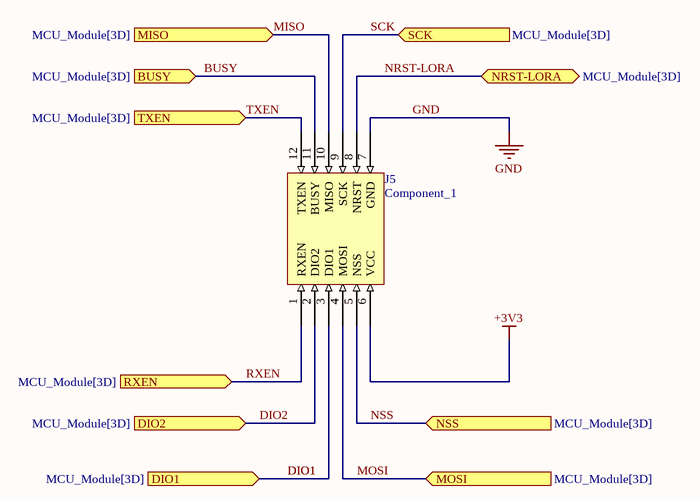
[diagram p5: LoRaModule.SchDoc]

### Parts
J5  Component_1  [DIP12-LoRa-Wireless-Maodule]

### Ports
BUSY (in, see MCU_Module[3D]), DIO1 (in, see MCU_Module[3D]), DIO2 (in, see MCU_Module[3D]), MISO (in, see MCU_Module[3D]), MOSI (in, see MCU_Module[3D]), NRST-LORA (bidir, see MCU_Module[3D]), NSS (in, see MCU_Module[3D]), RXEN (in, see MCU_Module[3D]), SCK (in, see MCU_Module[3D]), TXEN (in, see MCU_Module[3D])

### Nets
+3V3: J5.6(VCC)
GND: J5.7(GND)
BUSY: J5.11(BUSY) ; port BUSY
DIO1: J5.3(DIO1) ; port DIO1
DIO2: J5.2(DIO2) ; port DIO2
MISO: J5.10(MISO) ; port MISO
MOSI: J5.4(MOSI) ; port MOSI
NRST-LORA: J5.8(NRST) ; port NRST-LORA
NSS: J5.5(NSS) ; port NSS
RXEN: J5.1(RXEN) ; port RXEN
SCK: J5.9(SCK) ; port SCK
TXEN: J5.12(TXEN) ; port TXEN

## Sheet LED_blink.SchDoc
size A; SheetNumber: 7; SheetTotal: 7
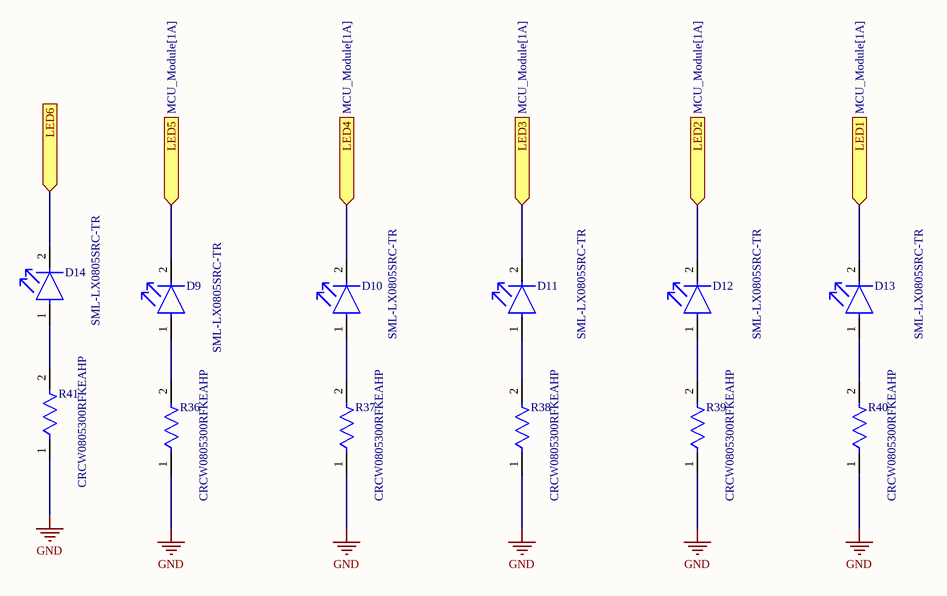
[diagram p6: LED_blink.SchDoc]

### Parts
D9  SML-LX0805SRC-TR  [FP-SML-LX0805SRC-TR-MFG]
D10  SML-LX0805SRC-TR  [FP-SML-LX0805SRC-TR-MFG]
D11  SML-LX0805SRC-TR  [FP-SML-LX0805SRC-TR-MFG]
D12  SML-LX0805SRC-TR  [FP-SML-LX0805SRC-TR-MFG]
D13  SML-LX0805SRC-TR  [FP-SML-LX0805SRC-TR-MFG]
D14  SML-LX0805SRC-TR  [FP-SML-LX0805SRC-TR-MFG]
R36  CRCW0805300RFKEAHP  [FP-CRCW0805-HPe3-IPC_A]
R37  CRCW0805300RFKEAHP  [FP-CRCW0805-HPe3-IPC_A]
R38  CRCW0805300RFKEAHP  [FP-CRCW0805-HPe3-IPC_A]
R39  CRCW0805300RFKEAHP  [FP-CRCW0805-HPe3-IPC_A]
R40  CRCW0805300RFKEAHP  [FP-CRCW0805-HPe3-IPC_A]
R41  CRCW0805300RFKEAHP  [FP-CRCW0805-HPe3-IPC_A]

### Ports
LED1 (in, see MCU_Module[1A]), LED2 (in, see MCU_Module[1A]), LED3 (in, see MCU_Module[1A]), LED4 (in, see MCU_Module[1A]), LED5 (in, see MCU_Module[1A]), LED6 (in)

### Nets
GND: R36.1 R37.1 R38.1 R39.1 R40.1 R41.1
NetD9_1: D9.1(A) R36.2
NetD9_2: D9.2(C) ; port LED5
NetD10_1: D10.1(A) R37.2
NetD10_2: D10.2(C) ; port LED4
NetD11_1: D11.1(A) R38.2
NetD11_2: D11.2(C) ; port LED3
NetD12_1: D12.1(A) R39.2
NetD12_2: D12.2(C) ; port LED2
NetD13_1: D13.1(A) R40.2
NetD13_2: D13.2(C) ; port LED1
NetD14_1: D14.1(A) R41.2
NetD14_2: D14.2(C) ; port LED6

### Library data of the parts
D9-D14 = CMP-57192-000013-1: LED RED CLEAR SMD; Forward Current: 20mA; Wavelength: 660nm; Forward Voltage: 1.7V; Luminous Intensity: 25mcd; Number of LEDs: 1; Current Rating: 25mA; Lens Color: Colorless; Power Rating: 100mW; Viewing Angle: 140°; Approvals: UL; Lens Transparency: Clear; Series: -; Package Quantity: 3000; Mount: Surface Mount; Lead Free: Lead Free; Case/Package: 0805; Max Operating Temperature: 85°C; Illumination Color: Red; Packaging: Tape and Reel; Length: 2mm; Lens Style: Clear; Width: 1.25mm; RoHS Compliant: Yes; Color: Red; Case Code (Metric): 2012; Dominant Wavelength: 660nm; Number of Pins: 2; Min Operating Temperature: -40°C; Case Code (Imperial): 0805; Voltage Rating (DC): 1.7V; Voltage Rating: 1.7V; Height: 1.2mm; Test Current: 20mA
R36-R41 = CMP-02407-003516-1: RES Thick Film, 300Ω, 1%, 0.5W, 100ppm/°C, 0805; Max Power Dissipation: 500mW; Power Rating: 330mW; Resistance: 300R; Width: 0.049inch; Tolerance: 1%; Composition: Thick Film; Contact Plating: Tin; Length: 0.079inch; Temperature Coefficient: 100ppm/°C; Termination: Wraparound; Lead Free: Lead Free; Height: 0.024inch; Packaging: Tape and Reel; Case/Package: 0805; Number of Terminations: 2; Min Operating Temperature: -55°C; Features: Automotive AEC-Q200; Mount: Surface Mount; Max Operating Temperature: 155°C; Package Quantity: 5000

## Nets that join several sheets
+3V3: Power_Module (R26.1 R28.2), Voltage_Sense (B5.8), Current_Sense (B4.8), MCU_Module (16 pins), LoRaModule (J5.6)
GND: Power_Module (8 pins), RVM_EF_Sheet1 (7 pins), Voltage_Sense (6 pins), Current_Sense (7 pins), MCU_Module (23 pins), LoRaModule (J5.7), LED_blink (6 pins)
INEG: Current_Sense (5 pins), MCU_Module (B3.15)
IPOS: Current_Sense (5 pins), MCU_Module (B3.14)
VNEG: Voltage_Sense (5 pins), MCU_Module (B3.17)
VPOS: Voltage_Sense (5 pins), MCU_Module (B3.16)